# EasyEDA Pro project StepMother2_EasyEDA-Pro-V2_2026-11-12.epro, board PCB1
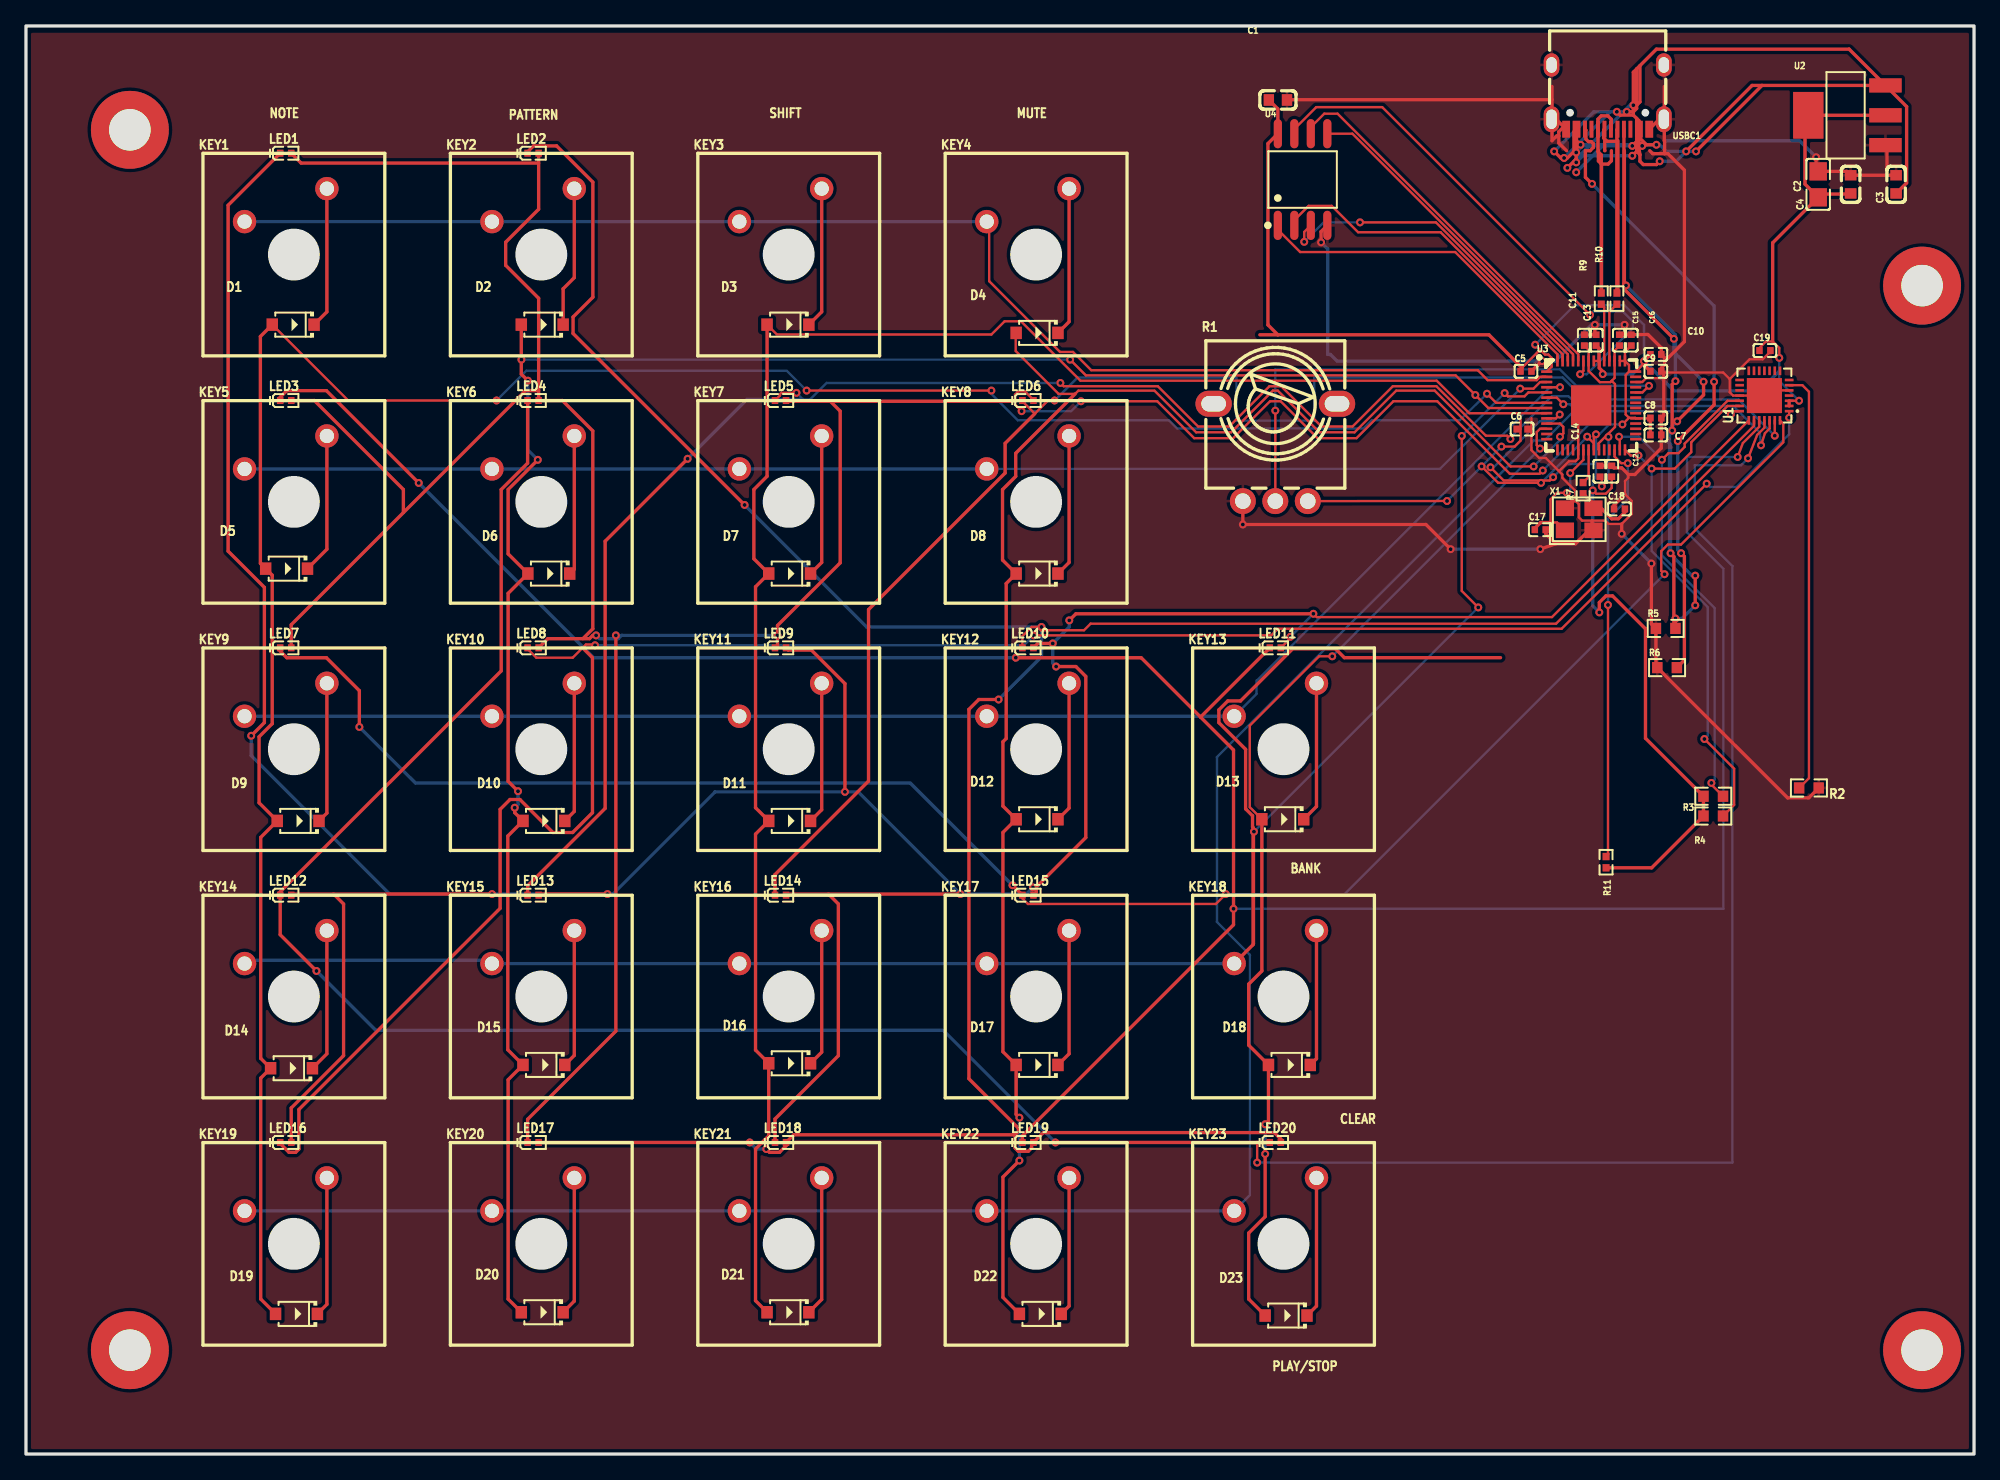
[diagram p2: board, top side]
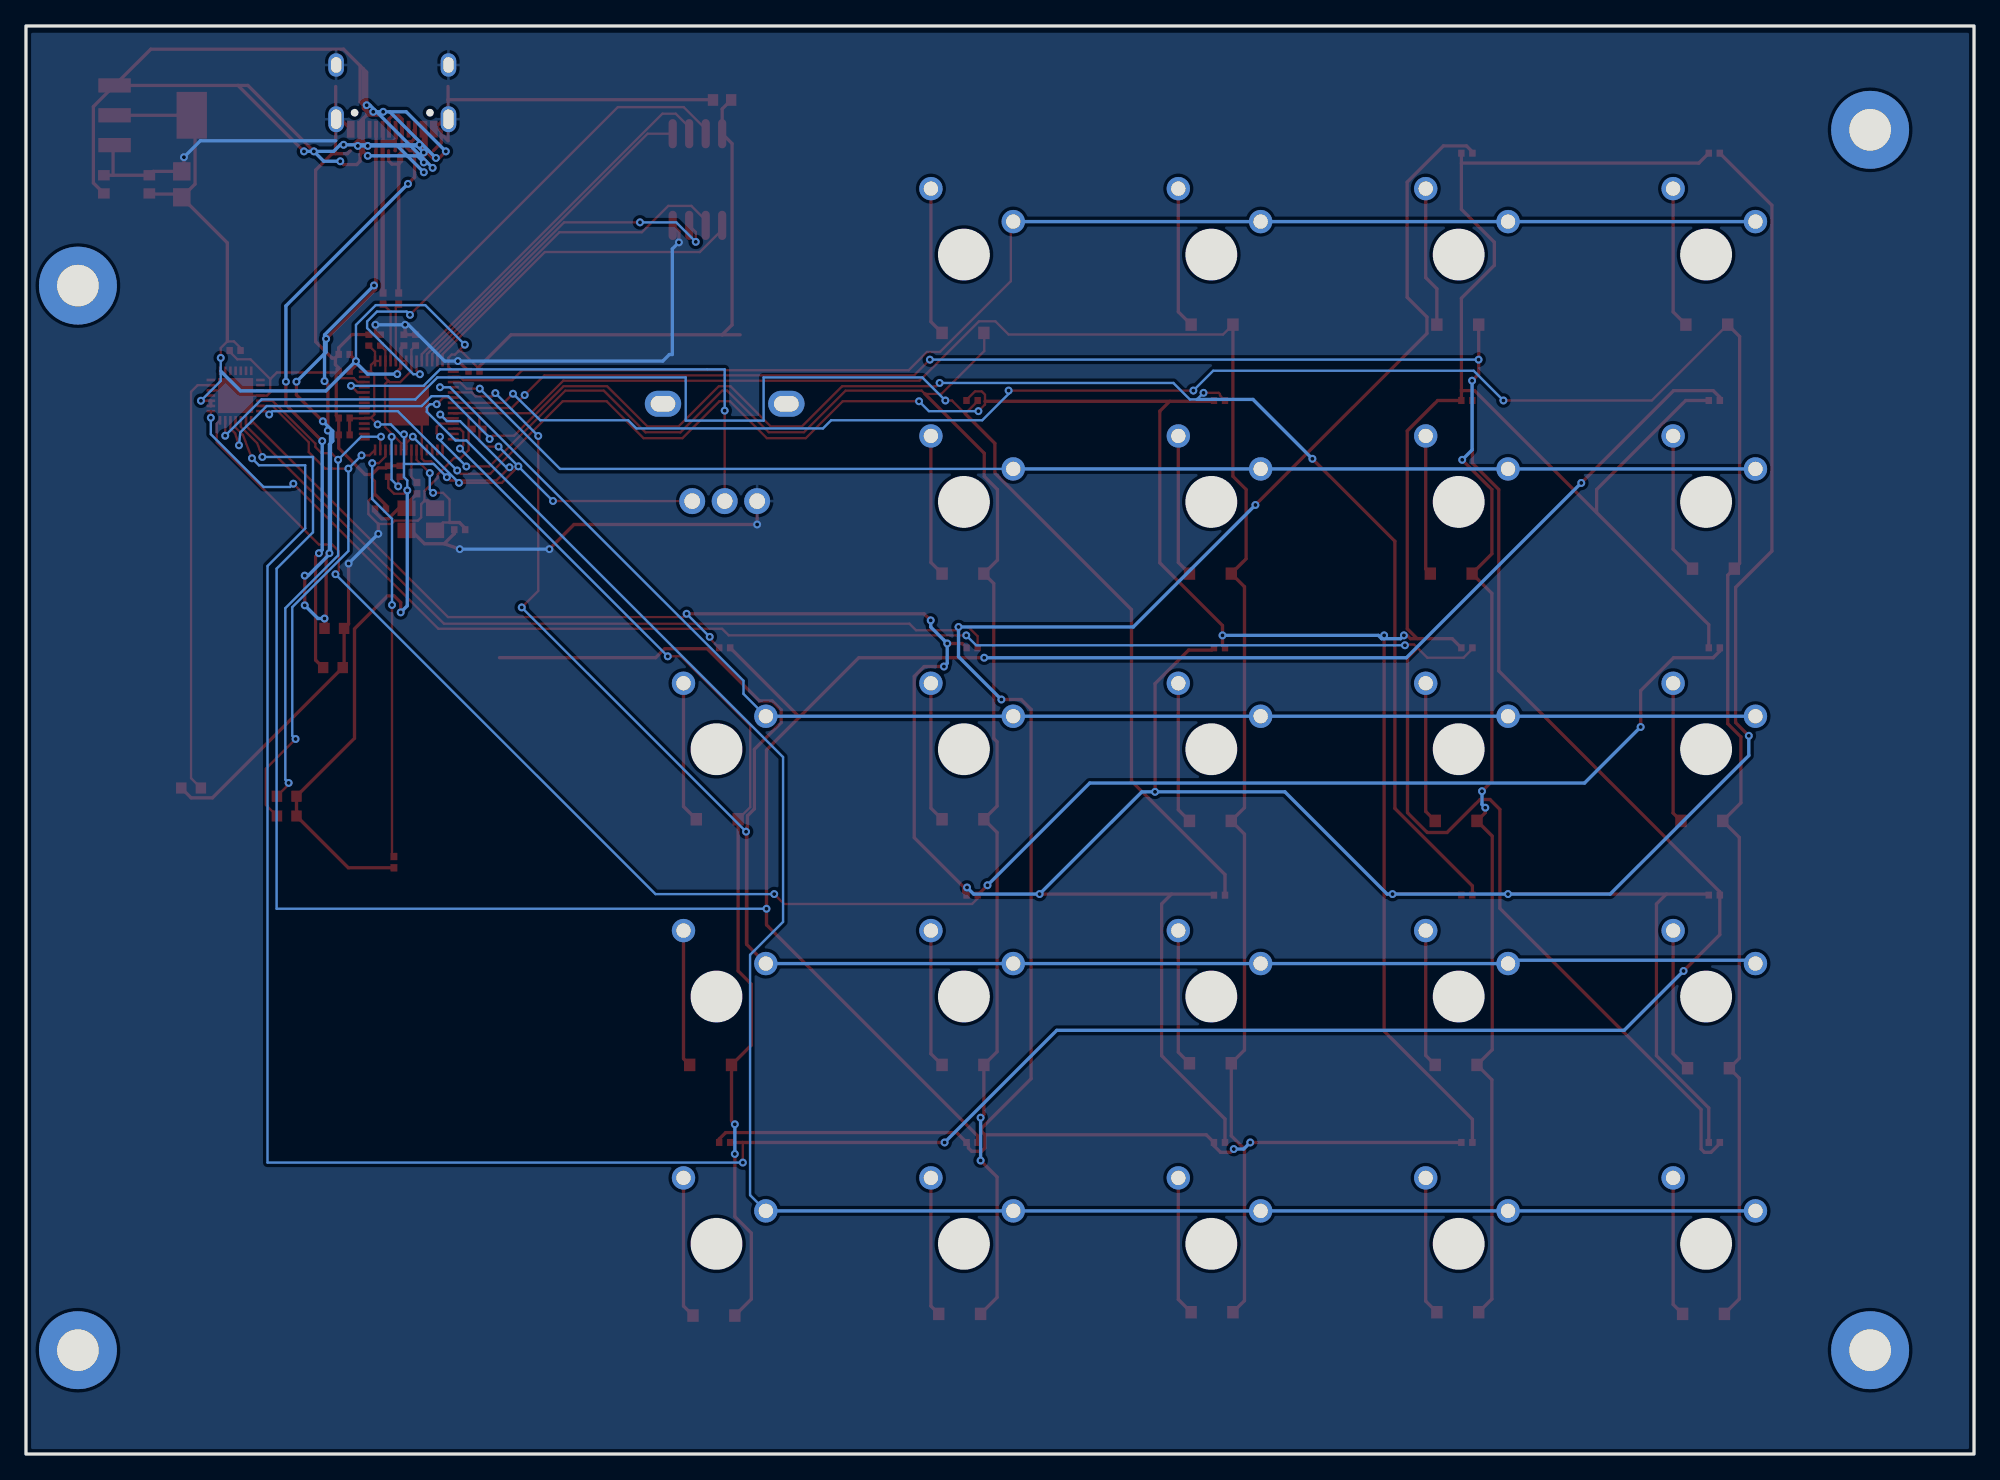
[diagram p3: board, bottom side, seen from below]

Outline 150 x 110 mm; copper layers: Top Layer, Bottom Layer. Coordinates in mm from the lower left corner of the outline.
Outline path: rectangle 0,110 150,0
Stack: Top Layer 0.035mm / Dielectric1 1.51mm FR4 er 4.5 / Bottom Layer 0.035mm

## Design rules (mm)
spacing copperThickness1oz (default): track to track 0.102, other pairs 0.152 to 0.3
spacing copperThickness2oz: track to track 0.203, other pairs 0.152 to 0.3
track width copperThickness1oz (default): min 0.127, default 0.254, max 2.54
track width copperThickness2oz: min 0.203, default 0.254, max 2.54
differential pair differentialPair (default): width min 0.127, default 0.254, max 2.54; gap min 0.152, default 0.152
net GND uses copperRegion

## Placement (name value [footprint] x y rotation side)
C1  100nF  [C0603]  96.4 104.3 0 top
C2  1uF  [C0603]  140.5 97.8 90 top
C3  10uF  [C0603]  144 97.8 90 top
C4  22uF  [C0805]  138 97.8 90 top
C5  100nF  [C0402]  115.5 83.4 0 top
C6  100nF  [C0402]  115.2 78.95 0 top
C7  100nF  [C0402]  125.5 78.5 0 top
C8  100nF  [C0402]  125.5 79.8 0 top
C9  100nF  [C0402]  125.5 83.4 0 top
C10  100nF  [C0402]  125.5 84.7 0 top
C11  100nF  [C0402]  120.9 85.8 90 top
C12  100nF  [C0402]  122.1 75.7 90 top
C13  100nF  [C0402]  120 85.8 90 top
C14  100nF  [C0402]  121.2 75.7 90 top
C15  1uF  [C0402]  122.7 85.8 90 top
C16  1uF  [C0402]  123.6 85.8 90 top
C17  15pF  [C0402]  116.6 71.2 0 top
C18  15pF  [C0402]  122.7 72.8 0 top
C19  100nF  [C0402]  133.9 85 0 top
D1  1N4148W  [SOD-123_L2.7-W1.6-LS3.7-FD]  20.57 87 0 top
D2  1N4148W  [SOD-123_L2.7-W1.6-LS3.7-FD]  39.75 87 0 top
D3  1N4148W  [SOD-123_L2.7-W1.6-LS3.7-FD]  58.67 87 0 top
D4  1N4148W  [SOD-123_L2.7-W1.6-LS3.7-FD]  77.85 86.36 0 top
D5  1N4148W  [SOD-123_L2.7-W1.6-LS3.7-FD]  20.07 68.2 0 top
D6  1N4148W  [SOD-123_L2.7-W1.6-LS3.7-FD]  40.26 67.82 0 top
D7  1N4148W  [SOD-123_L2.7-W1.6-LS3.7-FD]  58.8 67.82 0 top
D8  1N4148W  [SOD-123_L2.7-W1.6-LS3.7-FD]  77.85 67.82 0 top
D9  1N4148W  [SOD-123_L2.7-W1.6-LS3.7-FD]  20.95 48.77 0 top
D10  1N4148W  [SOD-123_L2.7-W1.6-LS3.7-FD]  39.88 48.77 0 top
D11  1N4148W  [SOD-123_L2.7-W1.6-LS3.7-FD]  58.8 48.77 0 top
D12  1N4148W  [SOD-123_L2.7-W1.6-LS3.7-FD]  77.85 48.89 0 top
D13  1N4148W  [SOD-123_L2.7-W1.6-LS3.7-FD]  96.77 48.89 0 top
D14  1N4148W  [SOD-123_L2.7-W1.6-LS3.7-FD]  20.45 29.72 0 top
D15  1N4148W  [SOD-123_L2.7-W1.6-LS3.7-FD]  39.88 29.97 0 top
D16  1N4148W  [SOD-123_L2.7-W1.6-LS3.7-FD]  58.8 30.1 0 top
D17  1N4148W  [SOD-123_L2.7-W1.6-LS3.7-FD]  77.85 29.97 0 top
D18  1N4148W  [SOD-123_L2.7-W1.6-LS3.7-FD]  97.28 29.97 0 top
D19  1N4148W  [SOD-123_L2.7-W1.6-LS3.7-FD]  20.83 10.79 0 top
D20  1N4148W  [SOD-123_L2.7-W1.6-LS3.7-FD]  39.75 10.92 0 top
D21  1N4148W  [SOD-123_L2.7-W1.6-LS3.7-FD]  58.67 10.92 0 top
D22  1N4148W  [SOD-123_L2.7-W1.6-LS3.7-FD]  78.1 10.79 0 top
D23  1N4148W  [SOD-123_L2.7-W1.6-LS3.7-FD]  97.03 10.67 0 top
KEY1  CPG151101D06  [KEY-TH_CPG151101D06]  20 96.2 0 top
KEY2  CPG151101D06  [KEY-TH_CPG151101D06]  39.05 96.2 0 top
KEY3  CPG151101D06  [KEY-TH_CPG151101D06]  58.1 96.2 0 top
KEY4  CPG151101D06  [KEY-TH_CPG151101D06]  77.15 96.2 0 top
KEY5  CPG151101D06  [KEY-TH_CPG151101D06]  20 77.15 0 top
KEY6  CPG151101D06  [KEY-TH_CPG151101D06]  39.05 77.15 0 top
KEY7  CPG151101D06  [KEY-TH_CPG151101D06]  58.1 77.15 0 top
KEY8  CPG151101D06  [KEY-TH_CPG151101D06]  77.15 77.15 0 top
KEY9  CPG151101D06  [KEY-TH_CPG151101D06]  20 58.1 0 top
KEY10  CPG151101D06  [KEY-TH_CPG151101D06]  39.05 58.1 0 top
KEY11  CPG151101D06  [KEY-TH_CPG151101D06]  58.1 58.1 0 top
KEY12  CPG151101D06  [KEY-TH_CPG151101D06]  77.15 58.1 0 top
KEY13  CPG151101D06  [KEY-TH_CPG151101D06]  96.2 58.1 0 top
KEY14  CPG151101D06  [KEY-TH_CPG151101D06]  20 39.05 0 top
KEY15  CPG151101D06  [KEY-TH_CPG151101D06]  39.05 39.05 0 top
KEY16  CPG151101D06  [KEY-TH_CPG151101D06]  58.1 39.05 0 top
KEY17  CPG151101D06  [KEY-TH_CPG151101D06]  77.15 39.05 0 top
KEY18  CPG151101D06  [KEY-TH_CPG151101D06]  96.2 39.05 0 top
KEY19  CPG151101D06  [KEY-TH_CPG151101D06]  20 20 0 top
KEY20  CPG151101D06  [KEY-TH_CPG151101D06]  39.05 20 0 top
KEY21  CPG151101D06  [KEY-TH_CPG151101D06]  58.1 20 0 top
KEY22  CPG151101D06  [KEY-TH_CPG151101D06]  77.15 20 0 top
KEY23  CPG151101D06  [KEY-TH_CPG151101D06]  96.2 20 0 top
LED1  YLED0402R  [LED0402-R-RD]  20 100.2 0 top
LED2  YLED0402R  [LED0402-R-RD]  39.05 100.2 0 top
LED3  YLED0402R  [LED0402-R-RD]  20 81.15 0 top
LED4  YLED0402R  [LED0402-R-RD]  39.05 81.15 0 top
LED5  YLED0402R  [LED0402-R-RD]  58.1 81.15 0 top
LED6  YLED0402R  [LED0402-R-RD]  77.15 81.15 0 top
LED7  YLED0402R  [LED0402-R-RD]  20 62.1 0 top
LED8  YLED0402R  [LED0402-R-RD]  39.05 62.1 0 top
LED9  YLED0402R  [LED0402-R-RD]  58.1 62.1 0 top
LED10  YLED0402R  [LED0402-R-RD]  77.15 62.1 0 top
LED11  YLED0402R  [LED0402-R-RD]  96.2 62.1 0 top
LED12  YLED0402R  [LED0402-R-RD]  20 43.05 0 top
LED13  YLED0402R  [LED0402-R-RD]  39.05 43.05 0 top
LED14  YLED0402R  [LED0402-R-RD]  58.1 43.05 0 top
LED15  YLED0402R  [LED0402-R-RD]  77.15 43.05 0 top
LED16  YLED0402R  [LED0402-R-RD]  20 24 0 top
LED17  YLED0402R  [LED0402-R-RD]  39.05 24 0 top
LED18  YLED0402R  [LED0402-R-RD]  58.1 24 0 top
LED19  YLED0402R  [LED0402-R-RD]  77.15 24 0 top
LED20  YLED0402R  [LED0402-R-RD]  96.2 24 0 top
NOREF  -  [Pad_e289]  146 90 0 top
NOREF#2  -  [Pad_e288]  8 102 0 top
NOREF#3  -  [Pad_e287]  146 8 0 top
NOREF#4  -  [Pad_e286]  8 8 0 top
R1  10kΩ  [RES-ADJ-TH_RK09L1140A5P]  96.2 77.15 0 top
R2  20kΩ  [R0603]  137.29 51.3 180 top
R3  4.7kΩ  [R0603]  129.92 50.67 180 top
R4  4.7kΩ  [R0603]  129.92 49.14 180 top
R5  5.1kΩ  [R0603]  126.26 63.6 0 top
R6  5.1kΩ  [R0603]  126.37 60.58 0 top
R7  1kΩ  [R0402]  119.9 74.4 90 top
R9  27Ω  [R0402]  121.3 89 90 top
R10  27Ω  [R0402]  122.5 89 90 top
R11  10kΩ  [R0402]  121.67 45.59 90 top
U1  IS31FL3731-QFLS2-TR  [QFN-28_L4.0-W4.0-P0.40-BL-EP]  133.86 81.53 90 top
U2  AMS1117-3.3  [SOT-223-3_L6.5-W3.4-P2.30-LS7.0-BR]  140.21 103.12 0 top
U3  RP2040  [LQFN-56_L7.0-W7.0-P0.4-EP]  120.52 80.77 0 top
U4  W25Q16JVSSIQ  [SOIC-8_L5.3-W5.3-P1.27-LS8.0-BL]  98.3 98.17 0 top
USBC1  TYPE-C-31-M-12  [USB-C_SMD-TYPE-C-31-M-12_1]  121.79 104.52 180 top
X1  12MHz  [CRYSTAL-SMD_4P-L3.2-W2.5-BL]  119.6 72 0 top

## Footprints (pads in the part's own frame, mm; a bottom-side part is the same pattern mirrored in y, then rotated)
C0402
  rect 0.5x0.54 smd: 1(-0.42,0) 2(0.42,0)
C0603
  rect 0.8x0.9 smd: 1(-0.7,0) 2(0.7,0)
C0805
  rect 1.41x1.35 smd: 1(-1,0) 2(1,0)
CRYSTAL-SMD_4P-L3.2-W2.5-BL
  rect 1.4x1.2 smd: 1(-1.1,-0.85) 2(1.1,-0.85) 3(1.1,0.85) 4(-1.1,0.85)
KEY-TH_CPG151101D06
  round 1.8 hole 1.1: 1(-3.17,-1.27) 2(3.17,1.27)
LED0402-R-RD
  rect 0.5x0.54 smd: 1(0.425,0) 2(-0.425,0)
LQFN-56_L7.0-W7.0-P0.4-EP
  rect 0.85x0.2 smd: 1(-3.425,2.6) 2(-3.425,2.2) 3(-3.425,1.8) 4(-3.425,1.4) 5(-3.425,1) 6(-3.425,0.6) 7(-3.425,0.2) 8(-3.425,-0.2) 9(-3.425,-0.6) 10(-3.425,-1) 11(-3.425,-1.4) 12(-3.425,-1.8) 13(-3.425,-2.2) 14(-3.425,-2.6) 29(3.425,-2.6) 30(3.425,-2.2) 31(3.425,-1.8) 32(3.425,-1.4) 33(3.425,-1) 34(3.425,-0.6) 35(3.425,-0.2) 36(3.425,0.2) 37(3.425,0.6) 38(3.425,1) 39(3.425,1.4) 40(3.425,1.8) 41(3.425,2.2) 42(3.425,2.6)
  rect 0.2x0.85 smd: 15(-2.6,-3.425) 16(-2.2,-3.425) 17(-1.8,-3.425) 18(-1.4,-3.425) 19(-1,-3.425) 20(-0.6,-3.425) 21(-0.2,-3.425) 22(0.2,-3.425) 23(0.6,-3.425) 24(1,-3.425) 25(1.4,-3.425) 26(1.8,-3.425) 27(2.2,-3.425) 28(2.6,-3.425) 43(2.6,3.425) 44(2.2,3.425) 45(1.8,3.425) 46(1.4,3.425) 47(1,3.425) 48(0.6,3.425) 49(0.2,3.425) 50(-0.2,3.425) 51(-0.6,3.425) 52(-1,3.425) 53(-1.4,3.425) 54(-1.8,3.425) 55(-2.2,3.425) 56(-2.6,3.425)
  rect 3.1x3.1 smd: 57(0,0)
Pad_e286
  round 6 hole 3.2: 1(0,0)
Pad_e287
  round 6 hole 3.2: 1(0,0)
Pad_e288
  round 6 hole 3.2: 2(0,0)
Pad_e289
  round 6 hole 3.2: 3(0,0)
QFN-28_L4.0-W4.0-P0.40-BL-EP
  rect 0.2x0.665 smd: 1(-1.2,-1.907) 2(-0.8,-1.907) 3(-0.4,-1.907) 4(0,-1.907) 5(0.4,-1.907) 6(0.8,-1.907) 7(1.2,-1.907) 15(1.2,1.907) 16(0.8,1.907) 17(0.4,1.907) 18(0,1.907) 19(-0.4,1.907) 20(-0.8,1.907) 21(-1.2,1.907)
  rect 0.665x0.2 smd: 8(1.907,-1.2) 9(1.907,-0.8) 10(1.907,-0.4) 11(1.907,0) 12(1.907,0.4) 13(1.907,0.8) 14(1.907,1.2) 22(-1.907,1.2) 23(-1.907,0.8) 24(-1.907,0.4) 25(-1.907,0) 26(-1.907,-0.4) 27(-1.907,-0.8) 28(-1.907,-1.2)
  rect 2.7x2.7 smd: 29(0,0)
R0402
  rect 0.566x0.54 smd: 1(-0.433,0) 2(0.433,0)
R0603
  rect 0.806x0.864 smd: 1(-0.753,0) 2(0.753,0)
RES-ADJ-TH_RK09L1140A5P
  round 2 hole 1.2: 1(-2.5,-3.75) 2(0,-3.75) 3(2.5,-3.75)
  oval 2.8x2 hole 1.9x1.2: 4(4.75,3.75) 5(-4.75,3.75)
SOD-123_L2.7-W1.6-LS3.7-FD
  rect 0.88x0.96 smd: 1(-1.61,0) 2(1.61,0)
SOIC-8_L5.3-W5.3-P1.27-LS8.0-BL
  oval 0.63x2.25 smd: 1(-1.905,-3.53) 2(-0.635,-3.53) 3(0.635,-3.53) 4(1.905,-3.53) 5(1.905,3.53) 6(0.635,3.53) 7(-0.635,3.53) 8(-1.905,3.53)
SOT-223-3_L6.5-W3.4-P2.30-LS7.0-BR
  rect 2.5x1.1 smd: 1(2.97,-2.3) 2(2.97,0) 3(2.97,2.3)
  rect 2.34x3.6 smd: 4(-2.97,0)
USB-C_SMD-TYPE-C-31-M-12_1
  oval 1.2x2 hole 0.8x1.5: 1(4.325,1.706) 4(-4.325,1.706)
  oval 1.2x1.8 hole 0.8x1.2: 2(4.325,-2.474) 3(-4.325,-2.474)
  custom 0.6x1.3 smd: A1B12(-3.2,2.474) A4B9(-2.4,2.474) B1A12(3.2,2.474) B4A9(2.401,2.474)
  rect 0.3x1.3 smd: A5(-1.25,2.474) A6(-0.25,2.474) A7(0.25,2.474) A8(1.25,2.474) B5(1.75,2.474) B6(0.75,2.474) B7(-0.75,2.474) B8(-1.75,2.474)

## Nets
As in the schematic.

Pads without a net: NOREF 3; NOREF#2 2; NOREF#3 1; NOREF#4 1; R1 4 5; U1 4 7 8 9 10 11 12 13 14 15 16 17; U3 13 14 15 16 17 18 24 25 29 30 31 32 34 35 36 37 39 41; USBC1 A8 B8

## Via types
v1: diameter 0.61, hole 0.305, Top Layer to Bottom Layer, 148 vias

## Routing (per net, layer and track width the routed paths; a pad name or vN(x,y) marks a point on that pad's centre or on a via; arc(x,y) is an arc through that point)
1V1: length 18.2
  Top Layer w0.18: C14.1 121.34,75.14 v1(121.34,74.54) ; 122.1,82.67 122.32,82.89 U3.45 122.32,85 C15.1 ; 122.1,82.67 122,82.56 121.19,82.56 120.32,83.43 U3.50 120.32,85.06 C13.1 ; 122.1,82.67 122.35,82.41 122.35,79.11 121.85,78.6 v1(121.85,78.35) 121.59,78.35 121.09,77.84 121.09,77.39 U3.23
  Bottom Layer w0.18: v1(121.85,78.35) 121.85,75.05 v1(121.34,74.54)
3V3: length 225.6
  Top Layer w0.18: 124.59,84.01 U3.42 123.43,83.37 ; U1.3 v1(136.53,81.13) ; 123.43,83.37 123.18,83.12 123.18,80.07 123.43,79.82 ; 123.43,83.37 123.43,83.89 U3.43 ; 123.43,79.82 v1(122.93,79.31) ; 123.43,79.82 123.9,79.82 U3.33 125.05,79.77 C8.1 ; v1(113.61,77.6) 114.63,77.6 115.08,78.05 115.08,79.8 ; U3.48 120.72,84.2 ; v1(116.21,85.45) 116.72,84.94 ; 116.72,84.94 116.97,84.69 117.22,84.69 117.48,84.43 117.48,83.75 U3.1 ; 116.72,84.94 116.46,84.94 115.19,83.67 C5.1 ; 120.72,77.86 120.72,78.38 v1(120.89,78.55) ; 120.72,77.86 120.72,77.35 ; 120.72,77.86 v1(120.22,78.36) ; C16.1 123.12,84.9 U3.43 ; v1(112.76,76.01) 113.78,74.99 117.34,74.99 v1(117.59,75.24) ; U3.43 122.72,84.2 ; C12.1 122.1,74.42 121.66,73.97 120.89,73.97 v1(120.64,74.23) ; v1(118.1,80.07) 117.8,79.77 U3.10 ; v1(135,84.43) 135,85.19 134.5,85.7 133.99,85.7 133.48,85.19 C19.1 ; v1(116.66,74.81) 113.36,74.81 v1(112.09,76.08) ; R1.3 v1(109.42,73.41)
  Top Layer w0.254: 96.4,86.21 112.65,86.21 115.19,83.67 ; 96.4,86.21 95.01,86.21 ; 96.4,86.21 95.63,86.97 95.63,100.94 U4.8 96.39,103.61 C1.1 ; 138.25,97.05 137.75,97.05 136.98,97.82 136.98,102.87 U2.4 U2.2 ; 138.25,97.05 C4.1 134.5,93.3 134.5,85.7 ; 138.25,97.05 140.45,97.05 C2.1 ; v1(124.59,84.18) 124.59,84.21 C10.1 ; C11.1 121.12,85.16 U3.48 121.14,84.18 121.14,83.66 121.41,83.39 v1(121.41,83.19) ; 124.59,84.01 124.59,83.89 C9.1 ; C8.1 C7.1 ; R11.1 125.18,45.16 R4.2 R3.2 124.7,55.13 124.7,63.56 122.16,66.1 121.66,66.1 121.15,65.59 v1(121.15,64.83) ; U1.2 U1.3
  Bottom Layer w0.18: v1(113.61,77.6) v1(112.09,76.08) v1(109.42,73.41) ; v1(124.59,84.18) 124.59,86.97 123.07,88.5 119.26,88.5 v1(116.21,85.45) ; v1(120.64,74.23) 120.64,74.99 120.89,75.24 120.89,76.26 ; v1(136.53,81.13) 135,82.65 v1(135,84.43) ; 120.89,76.26 v1(120.89,78.55) 121.15,78.55 121.91,79.31 v1(122.93,79.31) ; 120.89,76.26 118.61,76.26 v1(117.59,75.24) ; v1(120.22,78.36) v1(116.66,74.81) ; v1(112.76,76.01) 113.02,76.01 116.57,79.56 117.59,79.56 v1(118.1,80.07)
  Bottom Layer w0.254: v1(120.64,74.23) 120.64,65.34 v1(121.15,64.83) ; v1(121.41,83.19) 123.7,83.19 124.59,84.08 v1(124.59,84.18) 124.62,84.18 126.91,81.89 133.48,81.89 135,83.42
GND: length 237.8
  Top Layer w0.18: U3.40 124.45,82.57 124.75,82.87 126.11,82.87 ; C19.2 134.32,84.92 133.73,84.32 132.71,84.32 131.19,82.8 ; C9.2 126.11,83.31 130.68,83.31 131.19,82.8 ; 131.19,82.8 131.19,81.78 131.44,81.53 U1.18 U1.29 134.26,81.93 U1.5 ; 118.05,75.71 117.03,76.72 116.52,76.72 115.92,77.32 115.92,79.8 ; 118.05,75.71 118.81,76.47 119.32,76.47 119.52,76.67 U3.19 119.52,79.77 U3.57 ; 118.05,75.71 118.3,75.45 118.3,75.2 119.32,74.18 119.32,73.42 119.57,73.17 119.57,72.15 119.82,71.9 121.6,71.9 121.86,71.64 122.87,71.64 123.63,72.4 123.63,73.42 123.13,73.93 123.13,74.94 123.38,75.2 123.38,75.45
  Top Layer w0.254: USBC1.A1B12 125.76,102.82 USBC1.4 ; 120.59,71.39 119.32,70.12 117.79,70.12 ; 120.59,71.39 120.59,71.9 ; 120.59,71.39 X1.2 ; v1(116.74,84.19) 116.71,84.19 C5.2 ; 117.79,70.12 v1(116.6,69.7) ; 117.79,70.12 117.02,70.89 C17.2 ; 117.5,102.82 117.5,101.16 117.87,101.53 118.03,101.53 ; 117.5,102.82 117.5,104.32 ; 117.5,102.82 USBC1.1 ; 117.5,102.82 117.82,102.82 118.41,102.23 ; 126.17,84.42 126.17,83.91 125.92,83.65 C9.2 ; 126.17,84.42 126.43,84.42 127.7,85.69 127.7,98.89 126.43,100.16 126.17,100.16 ; 126.17,84.42 C10.2 125.92,85.21 124.89,86.24 C16.2 C15.2 ; R2.1 137.28,50.54 135.64,50.54 R6.1 125.5,60.68 R5.1 125.16,63.94 v1(125.16,68.59) ; 126.15,102.29 125.9,102.54 ; 126.15,102.29 126.15,105.34 ; 126.15,102.29 126.15,101.16 126.17,101.14 126.17,100.16 ; 126.17,100.16 125.26,100.16 125.03,100.39 ; U4.4 99.72,94.16 v1(99.72,93.33) ; 143.29,98.5 143.29,100.7 U2.1 ; 118.41,102.23 118.03,101.85 118.03,101.53 ; 118.41,102.23 118.59,102.05 ; 118.41,102.23 118.72,102.54 ; C18.1 122.28,73.08 123.13,73.93 ; C1.2 97.12,104.32 117.5,104.32 ; v1(137.84,99.89) 137.84,98.96 C4.2 140.2,98.8 C2.2 C3.2 ; 117.5,104.32 117.5,105.34 ; C13.2 C11.2 120.81,86.31 v1(120.81,86.98) ; C14.2 C12.2 122.26,75.96 122.87,75.96 123.38,75.45 123.89,75.45 125.92,77.48 C7.2 C8.2 126.11,79.99 126.11,83.31 ; 123.09,86.22 v1(123.09,86.98) ; 118.03,101.53 118.03,100.99 118.63,100.39 ; v1(109.7,69.7) 107.8,71.6 v1(93.7,71.6) R1.1 ; 119.32,73.42 119.07,73.42 X1.4 ; 122.87,71.64 v1(122.87,70.88)
  Bottom Layer w0.254: 126.15,101.16 136.57,101.16 v1(137.84,99.89) ; v1(122.87,70.88) v1(125.16,68.59) ; v1(109.7,69.7) v1(116.6,69.7) ; v1(99.72,93.33) 100.23,92.82 100.23,84.7 100.46,84.7 100.96,84.19 v1(116.74,84.19) 117.76,84.19 120.55,86.98 v1(120.81,86.98) v1(123.09,86.98)
VBUS: length 132.5
  Top Layer w0.254: 119.19,100.34 119.37,100.51 ; 119.19,100.34 118.69,99.83 118.18,99.83 v1(117.67,100.34) ; 119.19,100.34 119.19,101.85 119.37,102.02 ; 119.37,100.51 119.39,100.54 119.39,100.79 ; 119.37,100.51 119.37,101.08 ; 119.37,100.51 v1(119.37,100.25) 119.37,99.75 ; 124.02,103.9 123.77,103.64 ; 124.02,103.9 124.28,104.15 124.28,106.94 ; 124.02,103.9 124.02,103.64 123.77,103.39 ; 124.02,103.9 124.02,106.69 ; 124.02,103.9 v1(123.77,103.9) ; v1(123.77,103.9) 123.77,106.44 124.02,106.69 ; v1(123.77,103.9) 123.77,103.39 ; 123.77,103.13 124.02,102.88 ; 123.77,103.13 123.77,103.39 ; 123.77,103.13 122.75,103.13 v1(122.5,103.39) ; 124.02,102.88 124.02,102.22 USBC1.A4B9 ; 124.02,102.88 124.19,102.71 USBC1.A4B9 ; U2.3 140.38,108.21 125.54,108.21 124.02,106.69 ; U2.3 133.67,105.42 ; U2.3 144.81,103.79 144.81,97.91 C3.1 ; 123.77,103.39 v1(123.26,103.39) ; v1(127.83,100.34) 132.91,105.42 133.67,105.42 ; 124.02,101.1 124.02,101.36 ; 124.02,101.1 124.19,101.27 ; 124.02,101.1 v1(123.69,100.76) ; 124.02,101.1 124.02,100.34 124.02,100.34 ; 124.19,101.27 124.19,100.51 124.02,100.34 ; 124.19,101.27 USBC1.A4B9 ; 124.28,100.09 124.23,100.39 ; 124.28,100.09 124.28,99.58 124.53,99.32 125.54,99.32 v1(125.8,99.58) ; 124.28,100.09 124.02,100.34 ; 133.67,105.42 v1(128.59,100.34) ; 119.37,102.02 USBC1.B4A9 119.39,101.16 ; 119.37,102.02 119.37,101.08 ; 119.37,101.08 119.39,100.79 ; 119.39,100.79 119.43,100.39 ; 119.39,100.79 119.39,101.16 ; USBC1.A4B9 124.28,101.97 124.28,101.36 124.78,100.85 v1(125.54,100.85) ; 124.02,100.34 v1(123.69,100) ; v1(118.69,99.07) 119.37,99.75 ; 119.37,99.75 v1(119.37,99.49) ; 119.37,99.75 119.39,99.78 ; 119.39,101.16 v1(119.7,100.85) ; 124.19,101.02 v1(124.45,100.76)
  Bottom Layer w0.254: 121.99,103.39 v1(122.5,103.39) 123,103.39 ; 121.99,103.39 v1(118.43,99.83) ; 121.99,103.39 120.72,103.39 v1(117.67,100.34) ; 121.4,100.76 120.64,100 ; 120.64,100 119.88,100 v1(119.37,99.49) ; 120.64,100 v1(119.37,98.73) ; 120.64,100 v1(123.69,100) ; 120.38,100.76 v1(123.69,100.76) v1(124.45,100.76) ; 120.38,100.76 120.47,100.85 ; 120.38,100.76 119.88,100.76 v1(119.37,100.25) ; 120.38,100.76 v1(118.69,99.07) ; 120.47,100.85 v1(125.54,100.85) 125.8,100.85 126.31,100.34 v1(127.83,100.34) ; 120.47,100.85 123,103.39 ; 120.47,100.85 v1(119.7,100.85) ; v1(123.77,103.9) 123.51,103.9 123,103.39 ; v1(125.8,99.58) 127.07,99.58 v1(127.83,100.34) ; 123,103.39 v1(123.26,103.39) ; v1(127.83,100.34) v1(128.59,100.34)
CA1: length 271.9
  Top Layer w0.18: U1.21 131.53,80.33 v1(131.27,80.08) ; v1(76.66,80.33) 76.16,80.84 76.16,81.6 76.41,81.85 76.92,81.85 77.57,81.2 LED6.1 ; v1(81.24,81.09) 87.11,81.09 89.95,78.25 92.95,78.25 95.79,81.09 96.61,81.09 99.45,78.25 102.45,78.25 105.29,81.09 108.67,81.09 114.26,75.5 116.54,75.5 v1(116.8,75.76)
  Top Layer w0.254: LED1.1 21.19,99.44 39.47,99.44 ; 39.47,81.91 38.46,81.91 20.42,63.88 LED7.1 ; LED9.2 57.87,62.29 57.87,63.82 62.69,68.65 62.69,80.33 61.93,81.09 ; LED2.1 39.47,95.88 36.93,93.34 36.93,91.56 39.47,89.02 LED4.1 41.3,81.15 43.64,78.81 43.64,63.57 42.88,62.8 ; LED3.1 22.2,81.15 29.06,74.29 29.06,72.51 ; LED8.1 40.18,62.8 43.39,62.8 43.64,63.06 v1(43.9,63.06) ; 76.16,81.09 58.58,81.09 LED5.1 ; v1(45.42,63.06) 45.42,32.58 38.62,25.78 LED17.2
  Bottom Layer w0.18: v1(131.27,80.08) 131.02,80.33 121.37,80.33 v1(116.8,75.76) ; v1(76.66,80.33) 80.47,80.33 v1(81.24,81.09)
  Bottom Layer w0.254: v1(57.87,63.06) 45.87,63.06 45.61,62.8 44.15,62.8 v1(43.9,63.06) ; 45.42,62.8 v1(45.42,63.06)
CA2: length 301.6
  Top Layer w0.18: LED11.1 97.35,62.83 v1(97.35,62.94) ; U1.22 117.5,64.47 99.38,64.47 v1(99.13,64.72)
  Top Layer w0.254: 23.69,43.13 24.45,42.37 24.45,30.69 20.42,26.66 LED16.1 ; 77.79,43.64 v1(77.54,43.64) ; LED14.1 58.61,43.13 v1(71.95,43.13) ; v1(80.33,64.21) 80.84,64.72 v1(99.13,64.72) ; v1(63.06,51.01) 63.06,59.34 60.47,61.93 58.7,61.93 LED9.1 ; LED1.2 15.56,96.19 15.56,69.55 18.36,66.75 18.36,56.34 v1(17.34,55.32) ; LED18.2 57.67,25.81 62.55,30.69 62.55,42.37 61.79,43.13 ; v1(35.88,43.13) 20.51,43.13 LED12.1 ; LED10.1 77.91,62.44 v1(79.06,62.44) ; LED13.1 39.56,43.13 v1(44.77,43.13) ; v1(79.32,60.66) 80.84,60.66 81.6,59.9 81.6,47.48 77.79,43.67 77.79,43.27 LED15.1
  Bottom Layer w0.18: v1(99.13,64.72) v1(97.35,62.94)
  Bottom Layer w0.254: v1(80.33,64.21) 80.33,63.71 v1(79.06,62.44) 79.06,60.91 v1(79.32,60.66) ; v1(77.54,43.64) 77.03,43.13 v1(71.95,43.13) 64.08,51.01 v1(63.06,51.01) 53.06,51.01 45.19,43.13 v1(44.77,43.13) v1(35.88,43.13) 28.01,43.13 17.34,53.8 v1(17.34,55.32)
CA3: length 233.6
  Top Layer w0.18: U1.23 133.06,79.2 117.82,63.96 81.97,63.96 81.47,63.45 78.19,63.45 77.94,63.71 77.43,63.71 76.72,63 LED10.2
  Top Layer w0.254: LED20.1 96.62,24.25 96.12,24.76 78.34,24.76 LED19.1 77.43,23.86 77.43,23.57 77.18,23.32 76.42,23.32 76.16,23.57 76.16,24.59 ; 76.16,24.59 59.12,24.59 LED18.1 58.53,23.75 58.02,23.24 57.25,23.24 v1(57,23.49) ; 76.16,24.59 76.42,24.84 76.42,25.1 72.61,28.91 72.61,57.36 73.37,58.12 v1(74.89,58.12) ; LED2.2 38.62,100.31 39.08,100.76 40.86,100.76 43.65,97.97 43.65,89.11 42.13,87.58 42.13,86.31 v1(55.33,73.1) ; v1(55.73,24) LED17.1 ; 78.19,63.45 v1(78.19,63.71)
  Bottom Layer w0.254: v1(55.73,24) 56.24,23.49 v1(57,23.49) ; v1(74.89,58.12) 78.19,61.42 v1(78.19,63.71) 64.73,63.71 v1(55.33,73.1)
CA4: length 210.8
  Top Layer w0.18: 133.46,79.62 133.46,79.13 132.2,77.87 v1(131.8,76.8)
  Top Layer w0.254: v1(76.22,61.34) 85.87,61.34 90.44,56.77 ; 95.78,62.1 90.44,56.77 ; 90.44,56.77 92.98,54.23 92.98,40.76 76.72,24.51 LED19.2 ; v1(30.24,74.8) 23.13,81.91 20.08,81.91 19.57,81.4 LED3.2
  Bottom Layer w0.18: v1(92.98,42) 130.7,42 130.7,68.2 127.9,71 127.9,76.8 v1(131.8,76.8)
  Bottom Layer w0.254: v1(30.24,74.8) 43.7,61.34 v1(76.22,61.34)
CA5: length 232.5
  Top Layer w0.18: v1(132.6,76.7) 133.3,78.5 133.86,79.06 133.86,79.62 ; v1(94.8,22.45) 94.8,24
  Top Layer w0.254: v1(22.37,37.21) 19.58,40 LED12.2 19.58,43.3 36.59,60.32 36.59,74.29 38.62,76.32 LED4.2 ; v1(79.26,24) 95.78,24
  Bottom Layer w0.18: v1(94.8,22.45) 131.4,22.45 131.4,68.4 128.5,71.3 128.5,76.16 132.06,76.16 v1(132.6,76.7)
  Bottom Layer w0.254: v1(22.37,37.21) 26.94,32.64 70.63,32.64 v1(79.26,24)
CA6: length 139
  Top Layer w0.18: v1(59.33,81.74) 58.16,81.74 58.06,81.64 58.06,81.53 LED5.2 ; v1(133.6,77.7) 133.9,78.63 134.26,78.99 134.26,79.62 ; v1(114.3,78.19) 114.05,78.44 112.41,78.44 108.6,82.25 105.25,82.25 102.15,79.15 99.75,79.15 96.65,82.25 95.75,82.25 92.65,79.15 90.25,79.15 87.15,82.25 79.9,82.25 v1(79.65,82.5)
  Top Layer w0.254: LED13.2 38.62,43.77 44.6,49.74 44.6,70.31 v1(50.95,76.66)
  Bottom Layer w0.18: 133.5,78.69 131.46,80.72 119.53,80.72 118.76,81.49 117.49,81.49 114.45,78.44 v1(114.3,78.19) ; v1(59.33,81.74) 59.84,81.23 60.38,81.23 61.65,82.5 v1(79.65,82.5) ; v1(133.6,77.7) 133.5,78.69
  Bottom Layer w0.254: 59.84,81.23 55.52,81.23 v1(50.95,76.66)
CA7: length 114.6
  Top Layer w0.18: U1.27 v1(134.66,78.44) ; LED6.2 76.72,81.09 77.68,80.13 78.7,81.15 v1(79.2,81.15)
  Top Layer w0.254: 77.68,80.13 75.39,77.85 75.39,75.56 64.88,65.05 64.88,51.84 57.67,44.64 LED14.2
  Bottom Layer w0.18: v1(134.66,78.44) 131.86,81.23 120.02,81.23 118.32,82.93 99.2,82.93 99.2,79.6 93.2,79.6 93.2,82.93 80.98,82.93 v1(79.2,81.15)
CA8: length 143.8
  Top Layer w0.18: v1(126.17,67.77) 125.91,68.02 125.91,69.55 126.42,70.06 127.44,70.06 135.31,77.93 135.31,79.37 U1.28 ; LED15.2 76.72,42.8 77.15,42.37 91.62,42.37 v1(92.39,43.13)
  Top Layer w0.254: LED15.2 v1(75.96,43.81) ; v1(25.67,56) 25.67,58.8 23.13,61.34 20.08,61.34 19.58,61.85 LED7.2
  Bottom Layer w0.18: v1(92.39,43.13) 101.53,43.13 v1(126.17,67.77)
  Bottom Layer w0.254: v1(25.67,56) 29.99,51.69 68.09,51.69 v1(75.96,43.81)
CA9: length 163.3
  Top Layer w0.18: LED8.2 38.62,62.02 39.3,61.34 42.1,61.34 43.11,62.35 43.76,62.35 v1(43.82,62.3) ; v1(129.42,74.74) 118.24,63.57 96.4,63.57 95.89,63.06 v1(77.6,63.06) ; U1.1 v1(135.77,79.82)
  Top Layer w0.254: LED16.2 19.58,23.92 20.25,23.24 20.76,23.24 21.02,23.49 21.02,26.54 36.51,42.03 36.51,49.65 37.27,50.42 38.03,50.42 40.57,47.88 42.1,47.88 43.62,49.4 43.62,61.34 42.86,62.1
  Bottom Layer w0.18: v1(135.77,79.82) 135.77,78.55 131.7,74.49 129.67,74.49 v1(129.42,74.74) ; v1(77.6,63.06) 76.84,62.3 v1(43.82,62.3)
GP0: length 108
  Top Layer w0.18: 74.16,90.34 74.16,94.75 KEY4.1 ; 74.17,90.34 79.62,84.89 80.62,84.89 82.03,83.48 111.79,83.48 112.55,82.72 116.33,82.72 116.58,82.97 U3.2
  Bottom Layer w0.254: KEY4.1 KEY3.1 KEY2.1 KEY1.1
GP1: length 103
  Top Layer w0.18: U3.3 116.58,82.57 116.07,82.06 v1(115.06,82.06)
  Bottom Layer w0.18: KEY8.1 108.88,75.88 v1(115.06,82.06)
  Bottom Layer w0.254: KEY8.1 KEY7.1 KEY6.1 KEY5.1
GP2: length 113.4
  Top Layer w0.18: U3.4 v1(118.12,82.17)
  Bottom Layer w0.18: v1(118.12,82.17) 117.36,82.17 94.75,59.57 94.75,58.55 KEY13.1
  Bottom Layer w0.254: KEY9.1 KEY10.1 KEY11.1 KEY12.1 KEY13.1
GP3: length 176.6
  Top Layer w0.18: v1(111.83,65.21) 110.56,66.48 v1(110.56,78.42) ; v1(113.86,81.72) 114.11,81.47 115.38,81.47 115.69,81.77 U3.5 ; 94.49,39.24 94.55,39.3 v1(94.55,47.94)
  Top Layer w0.254: 113.54,61.34 101.51,61.34 100.82,62.03 97.54,62.03 93.52,58.01 92.54,58.01 91.85,57.32 91.85,56.34 93.91,54.28 93.91,49.7 94.44,49.16 94.44,48.3 94.49,48.26 94.49,39.24 KEY18.1
  Bottom Layer w0.18: v1(94.55,47.94) v1(111.83,65.21) ; v1(110.56,78.42) v1(113.86,81.72)
  Bottom Layer w0.254: KEY14.1 17.08,38.03 35.63,38.03 KEY15.1 KEY16.1 KEY17.1 KEY18.1
GP4: length 153.8
  Top Layer w0.18: v1(118.38,80.86) 117.87,81.37 U3.6
  Bottom Layer w0.18: KEY23.1 94.25,19.94 94.25,38.45 91.71,40.99 91.71,53.69 116.09,78.07 116.92,78.07 119.14,80.28 119.14,80.61 118.88,80.86 v1(118.38,80.86)
  Bottom Layer w0.254: KEY19.1 KEY20.1 KEY21.1 KEY22.1 KEY23.1
GP5: length 184.5
  Top Layer w0.18: D1.1 24.81,81.15 v1(36.24,81.15) ; v1(112.5,81.67) 113.2,80.97 U3.7 ; v1(60.11,81.92) v1(74.34,81.92)
  Top Layer w0.254: D1.1 18.05,86.08 18.05,68.61 D5.1 18.96,67.69 18.96,56.26 17.95,55.25 17.95,50.17 D9.1 18.08,47.5 18.08,30.48 D14.1 18.08,28.96 18.08,11.94 D19.1
  Bottom Layer w0.18: v1(60.11,81.92) 58.59,83.44 38.52,83.44 v1(36.24,81.15) ; v1(112.5,81.67) 110.4,79.63 ; v1(74.34,81.92) 74.34,81.66 76.37,79.63 88,79.63 88.63,79 103,79 103.63,79.63 110.4,79.63
GP6: length 161.8
  Top Layer w0.18: v1(80.4,84.3) 81.61,83.08 110.09,83.08 v1(111.6,81.57) 112.6,80.57 U3.8
  Top Layer w0.254: v1(39.41,76.58) 37.12,74.3 37.12,69.34 D6.1 37.12,66.29 37.12,51.82 v1(37.89,51.05) ; D2.1 38.14,83.19 v1(38.65,82.68) ; D20.1 37.12,11.94 37.12,28.83 D15.1 37.1,31.14 37.1,47.6 D10.1 37.63,49.4 v1(37.63,49.78)
  Bottom Layer w0.18: v1(80.4,84.3) v1(38.15,84.3)
  Bottom Layer w0.254: v1(37.89,51.05) 37.89,50.04 v1(37.63,49.78) ; v1(39.41,76.58) 38.65,77.34 v1(38.65,82.68)
GP7: length 143.1
  Top Layer w0.18: D3.1 57.83,86.23 74.34,86.23 75.35,87.25 76.62,87.25 81.19,82.68 108.63,82.68 111.13,80.17 U3.9
  Top Layer w0.254: D21.1 56.17,11.81 56.17,23.5 57.19,24.51 57.19,30.1 56.17,31.12 56.17,47.75 57.19,48.77 56.17,49.78 56.17,66.8 57.19,67.82 56.05,68.96 56.05,74.3 57.06,75.31 D3.1
GP8: length 132.3
  Top Layer w0.18: v1(116.09,76.07) 114.31,76.07 108.47,81.91 105.51,81.91 102.3,78.7 99.6,78.7 96.39,81.91 96.01,81.91 92.8,78.7 90.1,78.7 86.89,81.91 81.04,81.91 80.78,81.66 79.51,81.66 76.21,84.96 76.21,86.33 D4.1 ; U3.11 118.12,79.37 118.38,79.12 118.38,78.61 v1(118.12,78.36)
  Top Layer w0.254: v1(76.5,22.61) 75.22,21.34 75.22,12.06 76.5,10.79 ; v1(76.5,25.91) 76.24,26.16 D17.1 75.22,30.99 75.22,47.88 D12.1 75.22,49.91 75.22,54.86 75.48,55.12 75.48,67.06 D8.1 75.19,68.86 75.19,74.29 76.21,75.31 76.21,77.09 80.78,81.66
  Bottom Layer w0.18: v1(116.09,76.07) 118.12,78.1 v1(118.12,78.36)
  Bottom Layer w0.254: v1(76.5,25.91) v1(76.5,22.61)
GP9: length 81.5
  Top Layer w0.18: v1(116.58,77.45) 116.33,77.7 116.33,78.72 116.58,78.97 U3.12 ; D13.1 94.23,49.83 94.23,56.11 99.56,61.45 v1(100.58,61.45)
  Top Layer w0.254: D23.1 94.15,11.94 94.15,17.02 95.42,18.29 v1(95.42,23.11) ; v1(95.42,25.4) 95.67,25.65 D18.1 94.15,31.5 94.15,36.19 95.16,37.21 D13.1
  Bottom Layer w0.18: v1(116.58,77.45) v1(100.58,61.45)
  Bottom Layer w0.254: v1(95.42,25.4) v1(95.42,23.11)
GP16: length 41.2
  Top Layer w0.18: v1(129.78,51.69) 129.78,51.57 R3.1 ; v1(122.66,78.36) 122.72,78.3 122.72,77.35 ; v1(125.97,76.58) 126.47,77.09 127.24,77.09 127.72,77.57 127.72,77.83 131.02,81.13 U1.19
  Bottom Layer w0.18: v1(129.78,51.69) 130.03,51.95 130.03,65.16 125.97,69.22 v1(125.97,76.58) 124.19,78.36 v1(122.66,78.36)
GP17: length 41.8
  Top Layer w0.18: v1(125.18,75.9) 126.96,75.9 128.23,77.17 128.23,77.94 131.02,80.73 U1.20 ; v1(124.16,76.92) 123.55,76.92 U3.28 ; R4.1 131.53,50 131.53,52.79 v1(129.24,55.08)
  Bottom Layer w0.18: v1(129.24,55.08) 129.5,55.33 129.5,65.24 125.18,69.55 v1(125.18,75.9) v1(124.16,76.92)
GP26: length 40.7
  Top Layer w0.18: v1(124.97,82.28) 124.46,81.77 U3.38 ; v1(96.2,80.37) R1.2
  Bottom Layer w0.18: v1(124.97,82.28) 119.38,82.28 118.11,83.55 96.2,83.55 v1(96.2,80.37)
QSPI_SCLK: length 29.7
  Top Layer w0.18: U4.6 98.95,101.72 98.95,102.22 99.97,103.24 100.99,103.24 119.52,84.71 U3.52
QSPI_SD0: length 26.5
  Top Layer w0.18: U4.5 102.13,101.7 119.12,84.71 U3.53
QSPI_SD1: length 26.8
  Top Layer w0.18: U3.55 118.32,84.71 108.93,94.11 102.57,94.11 100.54,96.14 98.76,96.14 97.75,95.13 97.75,94.73 U4.2
QSPI_SD2: length 27.1
  Top Layer w0.18: U4.3 98.43,94.13 v1(98.43,93.37) ; 118.72,84.2 118.72,84.71 108.56,94.87 v1(102.72,94.87)
  Bottom Layer w0.18: v1(98.43,93.37) 99.93,94.87 v1(102.72,94.87)
QSPI_SD3: length 41.4
  Top Layer w0.18: U4.7 97.66,102.06 99.35,103.75 104.43,103.75 v1(120.43,87.75) ; U3.51 119.92,83.43 v1(119.67,83.17)
  Bottom Layer w0.18: v1(119.67,83.17) 120.18,83.17 123.73,86.73 123.73,87.24 122.97,88 120.69,88 v1(120.43,87.75)
QSPI_SS: length 26.4
  Top Layer w0.18: U4.1 96.59,94.45 96.59,94.11 98.11,92.59 110.05,92.59 117.92,84.71 U3.56
RUN: length 32.7
  Top Layer w0.18: R11.2 121.81,46.17 v1(121.81,65.4) ; v1(123.34,76.32) 122.83,76.32 122.32,76.83 U3.26
  Bottom Layer w0.18: v1(123.34,76.32) 123.34,73.56 121.81,72.04 v1(121.81,65.4)
USB_DM: length 27
  Top Layer w0.254: 122.5,101.12 121.74,101.12 121.48,101.37 121.48,101.99 USBC1.A7 ; 122.5,101.12 122.5,102 USBC1.B7 ; 122.5,101.12 R10.2 122.58,89.51 122.58,101.17 ; 121.56,101.17 121.56,100.41 121.58,100.39
USB_DP: length 28.2
  Top Layer w0.254: USBC1.A6 122.06,102.06 122.06,102.82 121.81,103.08 121.3,103.08 121.04,102.82 USBC1.B6 ; 122.08,100.39 122.08,99.62 121.82,99.36 121.32,99.36 ; 121.05,102.04 121.05,100.32 121.08,100.29 ; 121.32,99.36 121.32,89.45 R9.2 121.3,99.38 ; 121.32,99.36 121.3,99.38 ; 121.08,100.29 121.08,99.6 121.3,99.38 ; 121.08,100.29 121.08,100.39 ; 121.08,100.29 121.3,100.07 121.3,99.38
XIN: length 10
  Top Layer w0.18: U3.20 119.92,76.58 v1(118.91,75.56) ; v1(118.65,74.04) 117.89,74.04 117.38,73.53 117.38,71.75 117.9,71.75 X1.1
  Top Layer w0.254: 117.38,71.75 116.62,71.75 116.18,71.31 C17.1
  Bottom Layer w0.18: v1(118.91,75.56) 118.91,74.29 v1(118.65,74.04)
XOUT: length 2.7
  Top Layer w0.18: 119.9,74.83 120.32,75.26 U3.21
$1N4: length 10.9
  Top Layer w0.254: D1.2 23.17,87.98 KEY1.2
$1N5: length 10.8
  Top Layer w0.254: D2.2 41.36,89.76 42.22,90.62 KEY2.2
$1N7: length 10.9
  Top Layer w0.254: D3.2 61.27,87.98 KEY3.2
$1N9: length 11.5
  Top Layer w0.254: KEY4.2 80.32,87.22 D4.2
$1N13: length 10.8
  Top Layer w0.254: D5.2 23.17,69.69 KEY5.2
$1N15: length 10.7
  Top Layer w0.254: KEY6.2 42.22,68.17 D6.2
$1N17: length 11
  Top Layer w0.254: KEY7.2 61.27,68.68 D7.2
$1N19: length 11
  Top Layer w0.254: D8.2 80.32,68.68 KEY8.2
$1N21: length 10.9
  Top Layer w0.254: D9.2 23.17,49.37 KEY9.2
$1N23: length 10.9
  Top Layer w0.254: D10.2 42.22,49.5 KEY10.2
$1N25: length 11
  Top Layer w0.254: KEY11.2 61.27,49.63 D11.2
$1N27: length 10.8
  Top Layer w0.254: D12.2 80.32,49.75 KEY12.2
$1N29: length 10.9
  Top Layer w0.254: KEY13.2 99.37,49.88 D13.2
$1N31: length 11.1
  Top Layer w0.254: KEY14.2 23.17,30.83 D14.2
$1N33: length 10.7
  Top Layer w0.254: D15.2 42.22,30.7 KEY15.2
$1N35: length 10.6
  Top Layer w0.254: D16.2 61.27,30.96 KEY16.2
$1N37: length 10.7
  Top Layer w0.254: KEY17.2 80.32,30.83 D17.2
$1N39: length 10.5
  Top Layer w0.254: D18.2 99.37,30.45 KEY18.2
$1N41: length 10.8
  Top Layer w0.254: KEY19.2 23.17,11.53 D19.2
$1N43: length 10.7
  Top Layer w0.254: KEY20.2 42.22,11.78 D20.2
$1N45: length 10.8
  Top Layer w0.254: D21.2 61.27,11.91 KEY21.2
$1N47: length 10.7
  Top Layer w0.254: D22.2 80.32,11.4 KEY22.2
$1N49: length 10.9
  Top Layer w0.254: D23.2 99.37,11.4 KEY23.2
$2N73: length 32.6
  Top Layer w0.18: R2.2 137.29,52.06 137.29,81.82 136.78,82.33 U1.6
$2N145: length 82.9
  Top Layer w0.254: 123.08,90.14 123.04,90.17 USBC1.A5 ; 123.08,90.14 v1(123.2,90.01) ; 123.08,90.14 123.08,89.71 v1(126.89,85.9) ; 123.08,90.14 123.08,100.39 ; v1(126.63,69.39) 126.89,69.14 126.89,63.72 R5.2 v1(127.01,64.36) ; v1(127.14,79.55) 129.17,81.58 v1(129.17,82.6) ; v1(128.53,65.37) v1(128.53,67.66) ; v1(126.76,78.84) 126.76,82.39 v1(127.01,82.65)
  Bottom Layer w0.254: v1(126.89,85.9) 126.89,84.88 127.01,84.76 ; 126.55,77.85 126.63,77.77 v1(126.63,69.39) ; 126.55,77.85 126.55,78.63 v1(126.76,78.84) ; 126.55,77.85 126.38,78.03 126.38,78.79 v1(127.14,79.55) ; 126.55,77.85 126.55,69.39 128.28,67.66 v1(128.53,67.66) ; 127.01,84.76 v1(129.17,82.6) ; 127.01,84.76 127.01,86.2 v1(123.2,90.01) ; 127.01,84.76 v1(127.01,82.65) ; v1(127.01,64.36) 127.52,64.36 v1(128.53,65.37)
$2N147: length 48
  Top Layer w0.254: v1(129.98,82.6) 129.98,80.82 v1(127.19,78.03) ; v1(127.44,69.39) 127.7,69.14 127.7,61.15 R6.2 ; USBC1.B5 120.11,101.98 120.11,101.28 120.3,101.09 120.52,101.09 120.69,100.92 120.69,100.65 120.44,100.39 120.08,100.39 120.08,98.34 v1(120.59,97.84)
  Bottom Layer w0.254: v1(127.44,69.39) 127.19,69.64 v1(127.19,78.03) ; v1(120.59,97.84) 129.98,88.44 v1(129.98,82.6)
$2N201: length 4.7
  Top Layer w0.254: C18.2 123.12,72.55 122.61,72.04 122.1,72.04 121.34,72.8 120.75,72.8 X1.3 120.7,73.17 R7.1
$2N222: length 4.5
  Top Layer w0.18: R9.1 121.52,88.34 U3.47
$2N223: length 4.6
  Top Layer w0.18: R10.1 121.92,87.99 U3.46

## Copper pours and planes (outline as drawn; the poured copper is in the pictures)
GND on Top Layer: 0.38,109.47 149.61,109.47 149.61,0.38 0.38,0.38
GND on Bottom Layer: 0.38,109.47 149.61,109.47 149.61,0.38 0.38,0.38

## Text on the board
Top Silkscreen Layer: NOTE | PATTERN | SHIFT | MUTE | PLAY/STOP | BANK | CLEAR
